# Altium schematic sheet LORAPROJ_3.SchDoc
size A3; SheetNumber: 3; SheetTotal: 3
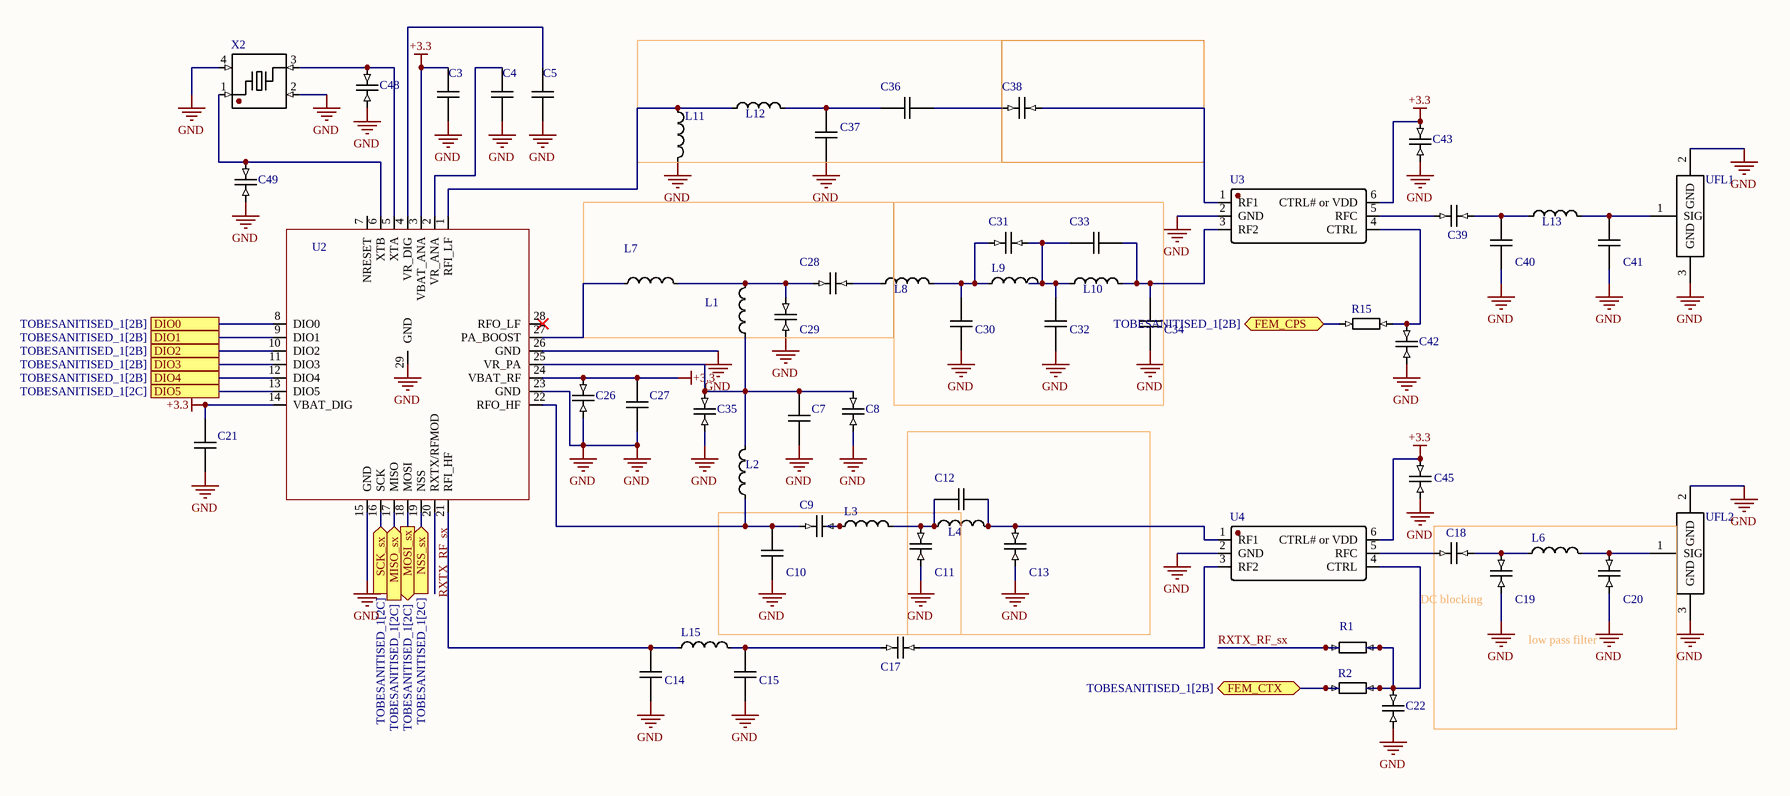
[diagram p0: LORAPROJ_3.SchDoc]

## Parts
C3  (no value)  [CAP_0603]
C4  (no value)  [CAP_0603]
C5  (no value)  [CAP_0603]
C7  (no value)  [CAP_0603]
C8  (no value)  [CAP_0603]
C9  (no value)  [CAP_0603]
C10  (no value)  [CAP_0603]
C11  (no value)  [CAP_0603]
C12  (no value)  [CAP_0603]
C13  (no value)  [CAP_0603]
C14  (no value)  [CAP_0603]
C15  (no value)  [CAP_0603]
C17  (no value)  [CAP_0603]
C18  (no value)  [CAP_0603]
C19  (no value)  [CAP_0603]
C20  (no value)  [CAP_0603]
C21  (no value)  [CAP_0603]
C22  (no value)  [CAP_0603]
C26  (no value)  [CAP_0603]
C27  (no value)  [CAP_0603]
C28  (no value)  [CAP_0603]
C29  (no value)  [CAP_0603]
C30  (no value)  [CAP_0603]
C31  (no value)  [CAP_0603]
C32  (no value)  [CAP_0603]
C33  (no value)  [CAP_0603]
C34  (no value)  [CAP_0603]
C35  (no value)  [CAP_0603]
C36  (no value)  [CAP_0603]
C37  (no value)  [CAP_0603]
C38  (no value)  [CAP_0603]
C39  (no value)  [CAP_0603]
C40  (no value)  [CAP_0603]
C41  (no value)  [CAP_0603]
C42  (no value)  [CAP_0603]
C43  (no value)  [CAP_0603]
C45  (no value)  [CAP_0603]
C48  (no value)  [CAP_0603]
C49  (no value)  [CAP_0603]
L1  (no value)  [IND_0603]
L2  (no value)  [IND_0603]
L3  (no value)  [IND_0603]
L4  (no value)  [IND_0603]
L6  (no value)  [IND_0603]
L7  (no value)  [IND_0603]
L8  (no value)  [IND_0603]
L9  (no value)  [IND_0603]
L10  (no value)  [IND_0603]
L11  (no value)  [IND_0603]
L12  (no value)  [IND_0603]
L13  (no value)  [IND_0603]
L15  (no value)  [IND_0603]
R1  (no value)  [RES_0603]
R2  (no value)  [RES_0603]
R15  (no value)  [RES_0603]
U2  (no value)  [QFN-28_6x6_P0.65_EP]
U3  (no value)  [SC-70-6]
U4  (no value)  [SC-70-6]
UFL1  (no value)  [RF_COAX_SMD]
UFL2  (no value)  [RF_COAX_SMD]
X2  (no value)  [XTAL_SMD_2016_4P]

## Blocks framed on the sheet
low pass filter: C18-C20 L6

## Ports
DIO0 (see TOBESANITISED_1[2B]), DIO1 (see TOBESANITISED_1[2B]), DIO2 (see TOBESANITISED_1[2B]), DIO3 (see TOBESANITISED_1[2B]), DIO4 (see TOBESANITISED_1[2B]), DIO5 (see TOBESANITISED_1[2C]), FEM_CPS (bidir, see TOBESANITISED_1[2B]), FEM_CTX (bidir, see TOBESANITISED_1[2B]), MISO_sx (in, see TOBESANITISED_1[2C]), MOSI_sx (out, see TOBESANITISED_1[2C]), NSS_sx (in, see TOBESANITISED_1[2C]), SCK_sx (in, see TOBESANITISED_1[2C])

## Nets
+3.3: C3.1 C21.2 C26.2 C27.2 C43.2 C45.2 U2.3(VBAT_ANA) U2.14(VBAT_DIG) U2.24(VBAT_RF) U3.6(CTRL#_or_VDD) U4.6(CTRL#_or_VDD)
GND: C3.2 C4.2 C5.2 C7.1 C8.1 C10.1 C11.1 C13.1 C14.1 C15.1 C19.1 C20.1 C21.1 C22.1 C26.1 C27.1 C29.1 C30.2 C32.1 C34.2 C35.1 C37.2 C40.2 C41.2 C42.1 C43.1 C45.1 C48.1 C49.1 L11.2 U2.15(GND) U2.23(GND) U2.26(GND) U2.29(GND) U3.2(GND) U4.2(GND) UFL1.2(GND) UFL1.3(GND) UFL2.2(GND) UFL2.3(GND) X2.2(GND) X2.4(GND)
DIO0: U2.8(DIO0) ; port DIO0
DIO1: U2.9(DIO1) ; port DIO1
DIO2: U2.10(DIO2) ; port DIO2
DIO3: U2.11(DIO3) ; port DIO3
DIO4: U2.12(DIO4) ; port DIO4
DIO5: U2.13(DIO5) ; port DIO5
FEM_CPS: R15.1 ; port FEM_CPS
FEM_CTX: R2.1 ; port FEM_CTX
MISO_sx: U2.17(MISO) ; port MISO_sx
MOSI_sx: U2.18(MOSI) ; port MOSI_sx
NSS_sx: U2.19(NSS) ; port NSS_sx
RXTX_RF_sx: R1.2 U2.20(RXTX/RFMOD)
SCK_sx: U2.16(SCK) ; port SCK_sx
NetC4_1: C4.1 U2.2(VR_ANA)
NetC5_1: C5.1 U2.4(VR_DIG)
NetC7_2: C7.2 C8.2 C35.2 L1.1 L2.1 U2.25(VR_PA)
NetC9_1: C9.1 C10.2 L2.2 U2.22(RFO_HF)
NetC9_2: C9.2 L3.1
NetC11_2: C11.2 C12.1 L3.2 L4.1
NetC12_2: C12.2 C13.2 L4.2 U4.1(RF1)
NetC14_2: C14.2 L15.1 U2.21(RFI_HF)
NetC15_2: C15.2 C17.2 L15.2
NetC17_1: C17.1 U4.3(RF2)
NetC18_1: C18.1 U4.5(RFC)
NetC18_2: C18.2 C19.2 L6.1
NetC20_2: C20.2 L6.2 UFL2.1(SIG)
NetC22_2: C22.2 R1.1 R2.2 U4.4(CTRL)
NetC28_1: C28.1 C29.2 L1.2 L7.2
NetC28_2: C28.2 L8.2
NetC30_1: C30.1 C31.1 L8.1 L9.1
NetC31_2: C31.2 C32.2 C33.2 L9.2 L10.2
NetC33_1: C33.1 C34.1 L10.1 U3.3(RF2)
NetC36_1: C36.1 C37.1 L12.1
NetC36_2: C36.2 C38.1
NetC38_2: C38.2 U3.1(RF1)
NetC39_1: C39.1 U3.5(RFC)
NetC39_2: C39.2 C40.1 L13.2
NetC41_1: C41.1 L13.1 UFL1.1(SIG)
NetC42_2: C42.2 R15.2 U3.4(CTRL)
NetC48_2: C48.2 U2.5(XTA) X2.3
NetC49_2: C49.2 U2.6(XTB) X2.1
NetL7_1: L7.1 U2.27(PA_BOOST)
NetL11_1: L11.1 L12.2 U2.1(RFI_LF)

Not connected (* = marked no-connect by the designer): U2 7(NRESET) 28(RFO_LF)*

## Notes on the sheet
- (near C19) DC blocking

## Library data of the parts
C3-C5 C7-C15 C17-C22 C26-C43 C45 C48 C49 = CAP: Package: CAP_0603
L1-L4 L6-L13 L15 = IND: Package: IND_0603
R1 R2 R15 = RES: Package: RES_0603
U2 = IC_U2: Package: QFN-28_6x6_P0.65_EP
U3 = IC_U3: Package: SC-70-6
U4 = IC_U4: Package: SC-70-6
UFL1 UFL2 = CONN_RF: Package: RF_COAX_SMD
X2 = XTAL: Package: XTAL_SMD_2016_4P